# Altium project EFI_Main_Board-V1.11.PrjPcb (part 2 of 4)
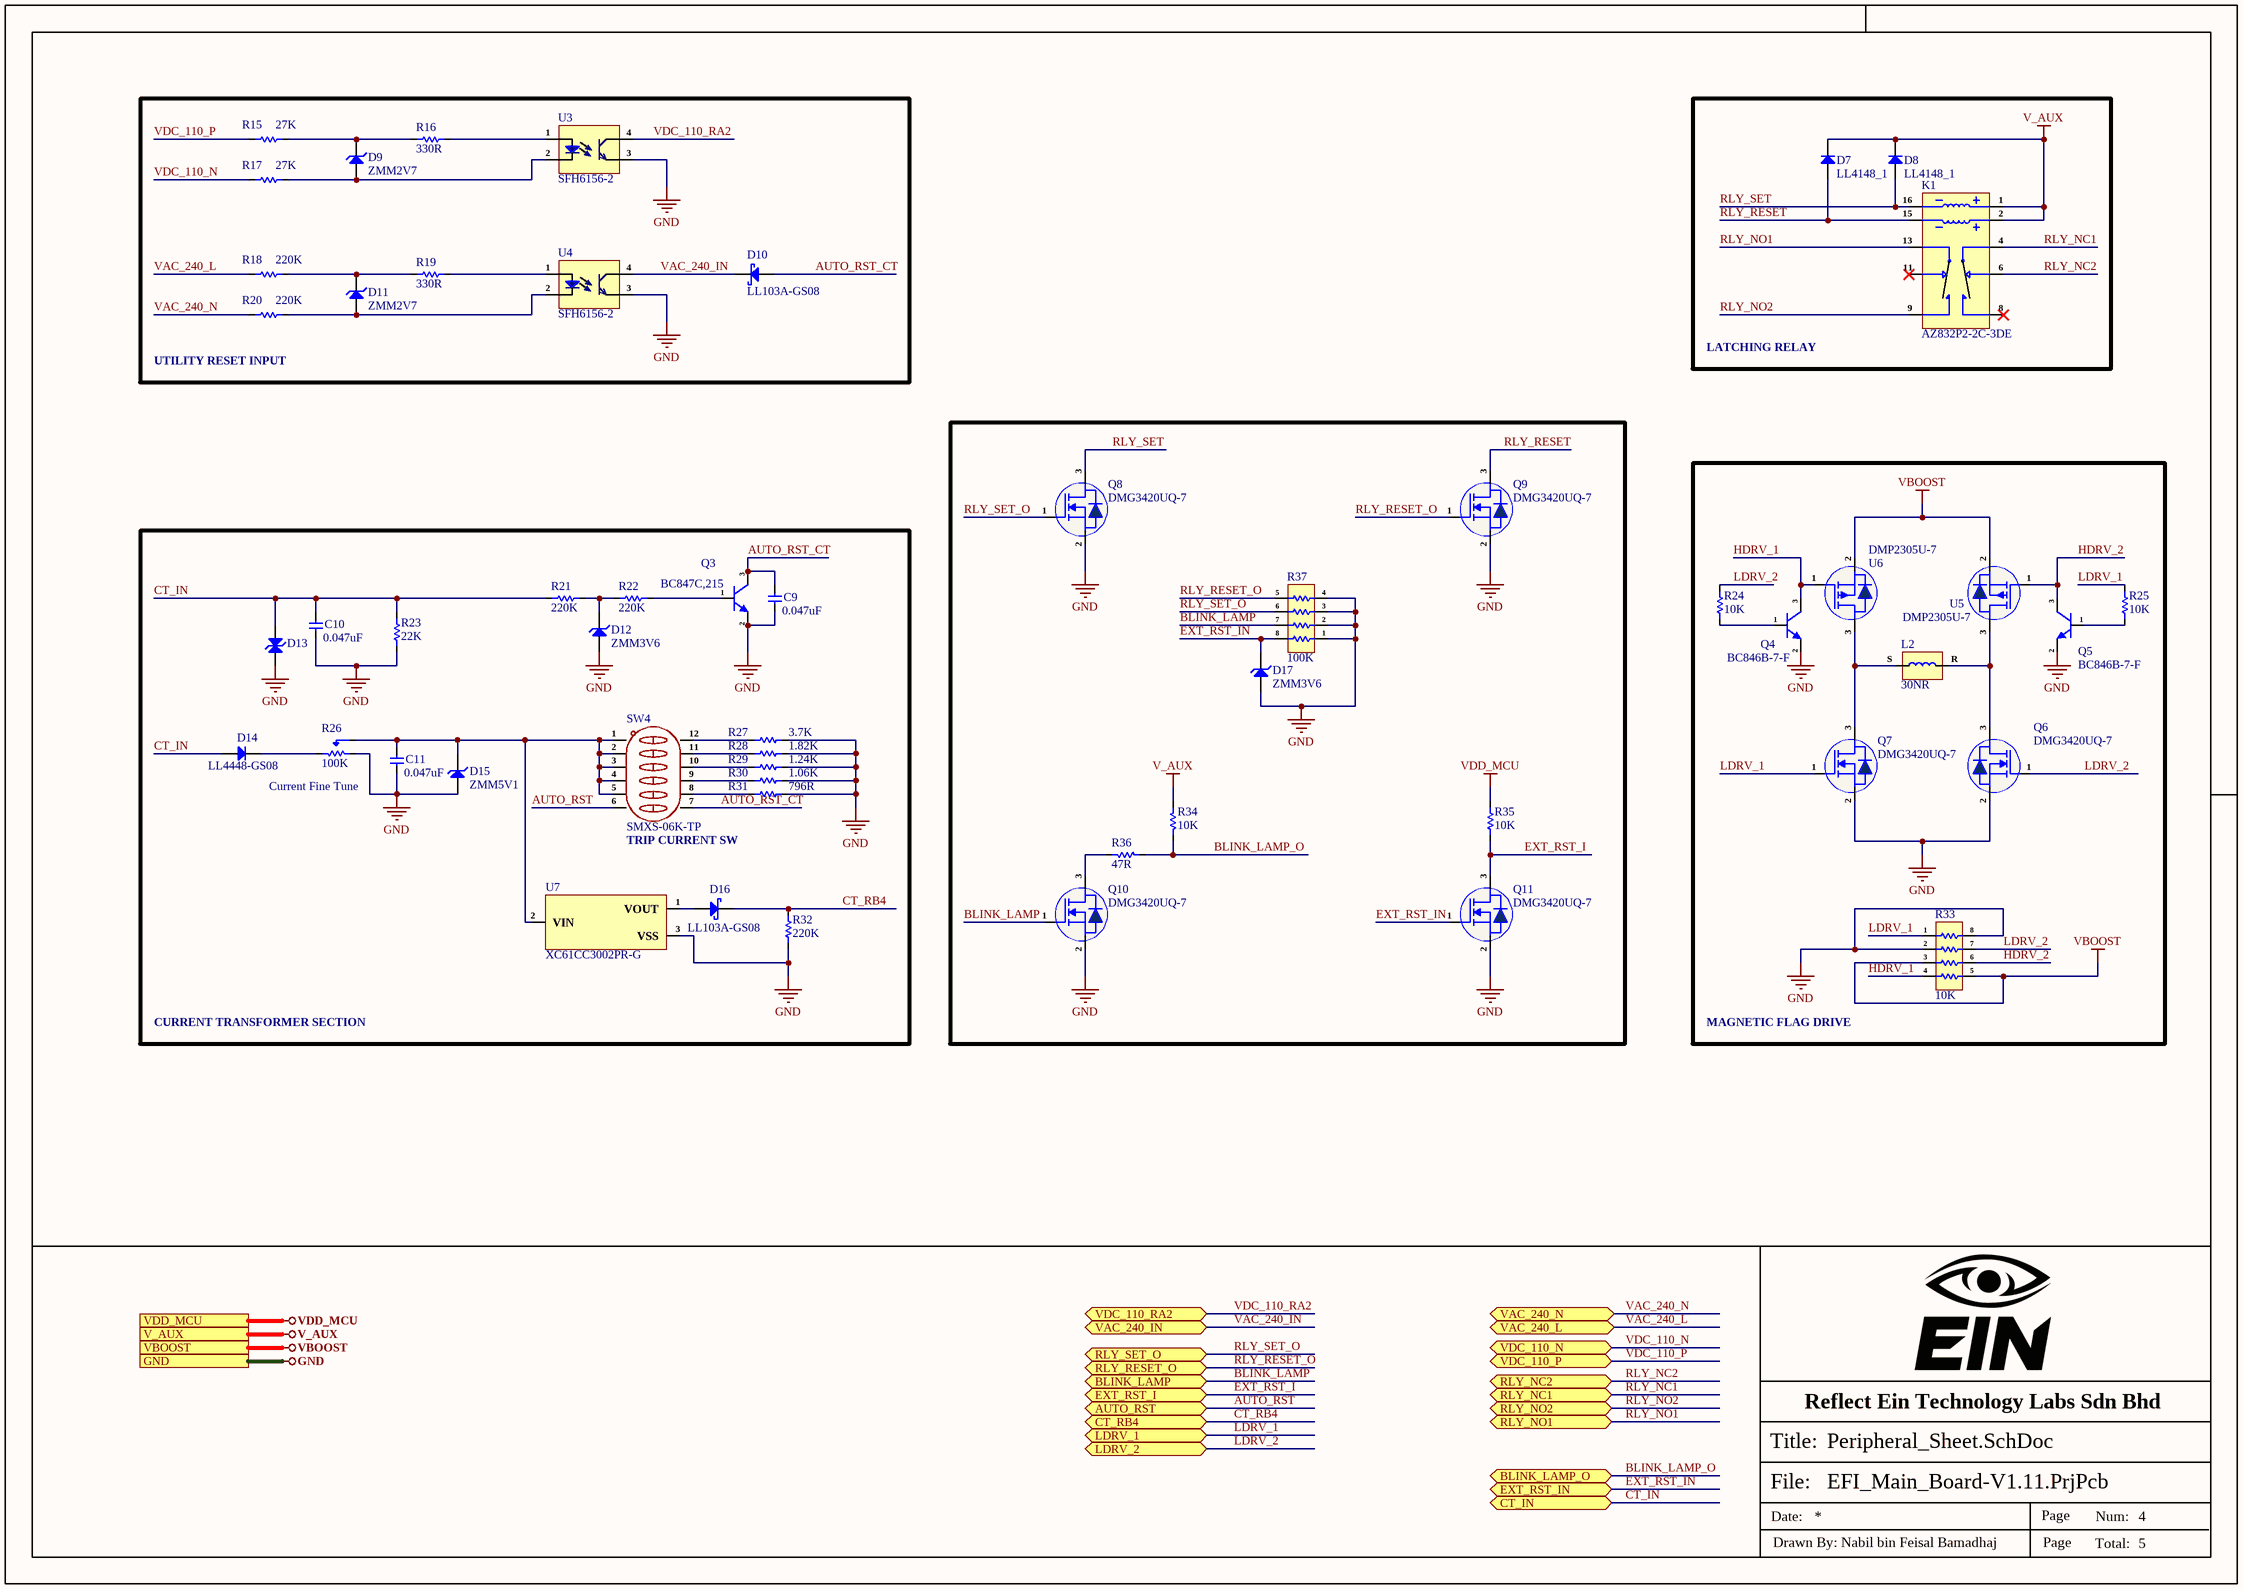
[diagram p5: Peripheral_Sheet.SchDoc]

## Sheet Peripheral_Sheet.SchDoc (continued)

### Nets
GND: C9.1 C10.1 C11.1 D12.2(A) D13.1(A) D15.2(A) D17.2(A) Q3.2(E) Q4.2(E) Q5.2(E) Q6.2(S) Q7.2(S) Q8.2(S) Q9.2(S) Q10.2(S) Q11.2(S) R23.1 R26.1(CCW) R27.2 R28.2 R29.2 R30.2 R31.2 R32.2 R33.2 R33.8 R37.1 R37.2 R37.3 R37.4 U3.3(E) U4.3(E) U7.3(VSS) ; port GND
V_AUX: D7.1(K) D8.1(K) K1.1 K1.2 R34.2 ; port V_AUX
VBOOST: R33.3 R33.5 U5.2(S) U6.2(S) ; port VBOOST
VDD_MCU: R35.2 ; port VDD_MCU
AUTO_RST: SW4.6 ; port AUTO_RST
AUTO_RST_CT: C9.2 D10.2(A) Q3.3(C) SW4.7
BLINK_LAMP: Q10.1(G) R37.7 ; port BLINK_LAMP
BLINK_LAMP_O: R34.1 R36.1 ; port BLINK_LAMP_O
CT_IN: C10.2 D13.2(A) D14.2(A) R21.2 R23.2 ; port CT_IN
CT_RB4: D16.1(K) R32.1 ; port CT_RB4
EXT_RST_I: Q11.3(D) R35.1 ; port EXT_RST_I
EXT_RST_IN: D17.1(K) Q11.1(G) R37.8 ; port EXT_RST_IN
HDRV_1: Q4.3(C) R33.4 U6.1(G)
HDRV_2: Q5.3(C) R33.6 U5.1(G)
LDRV_1: Q7.1(G) R25.2 R33.1 ; port LDRV_1
LDRV_2: Q6.1(G) R24.2 R33.7 ; port LDRV_2
RLY_NC1: K1.4 ; port RLY_NC1
RLY_NC2: K1.6 ; port RLY_NC2
RLY_NO1: K1.13 ; port RLY_NO1
RLY_NO2: K1.9 ; port RLY_NO2
RLY_RESET: D7.2(A) K1.15 Q9.3(D)
RLY_RESET_O: Q9.1(G) R37.5 ; port RLY_RESET_O
RLY_SET: D8.2(A) K1.16 Q8.3(D)
RLY_SET_O: Q8.1(G) R37.6 ; port RLY_SET_O
VAC_240_IN: D10.1(K) U4.4(C) ; port VAC_240_IN
VAC_240_L: R18.2 ; port VAC_240_L
VAC_240_N: R20.2 ; port VAC_240_N
VDC_110_N: R17.1 ; port VDC_110_N
VDC_110_P: R15.1 ; port VDC_110_P
VDC_110_RA2: U3.4(C) ; port VDC_110_RA2
NetC11_2: C11.2 D15.1(K) R26.2(Wiper) SW4.1 SW4.2 SW4.3 SW4.4 SW4.5 U7.2(VIN)
NetD9_1: D9.1(K) R15.2 R16.1
NetD9_2: D9.2(A) R17.2 U3.2(Ca)
NetD11_1: D11.1(K) R18.1 R19.1
NetD11_2: D11.2(A) R20.1 U4.2(Ca)
NetD12_1: D12.1(K) R21.1 R22.2
NetD14_1: D14.1(K) R26.3(CW)
NetD16_2: D16.2(A) U7.1(VOUT)
NetL2_R: L2.R Q6.3(D) U5.3(D)
NetL2_S: L2.S Q7.3(D) U6.3(D)
NetQ3_1: Q3.1(B) R22.1
NetQ4_1: Q4.1(B) R24.1
NetQ5_1: Q5.1(B) R25.1
NetQ10_3: Q10.3(D) R36.2
NetR16_2: R16.2 U3.1(An)
NetR19_2: R19.2 U4.1(An)
NetR27_1: R27.1 SW4.12
NetR28_1: R28.1 SW4.11
NetR29_1: R29.1 SW4.10
NetR30_1: R30.1 SW4.9
NetR31_1: R31.1 SW4.8

Not connected (* = marked no-connect by the designer): K1 8* 11*

### Notes on the sheet
- Current Fine Tune
- (near SW4) TRIP CURRENT SW
- CURRENT TRANSFORMER SECTION
- Reflect Ein Technology Labs Sdn Bhd
- File:
- Title:
- Date:
- Page
- Num:
- Total:
- Drawn By: Nabil bin Feisal Bamadhaj